# Altium schematic sheet Power Regulation and Interfaces.SchDoc
size A4; SPICEModelCacheAAATKUSZ: <root> / <DocumentId>AAATKUSZ</DocumentId> / </root>; Organization: ORGANIZATION; Address1: ADDRESS 1; Address2: ADDRESS 2; Address3: ADDRESS 3; Address4: ADDRESS 4; Revision: *.*.*; SheetNumber: 1; SheetTotal: 2
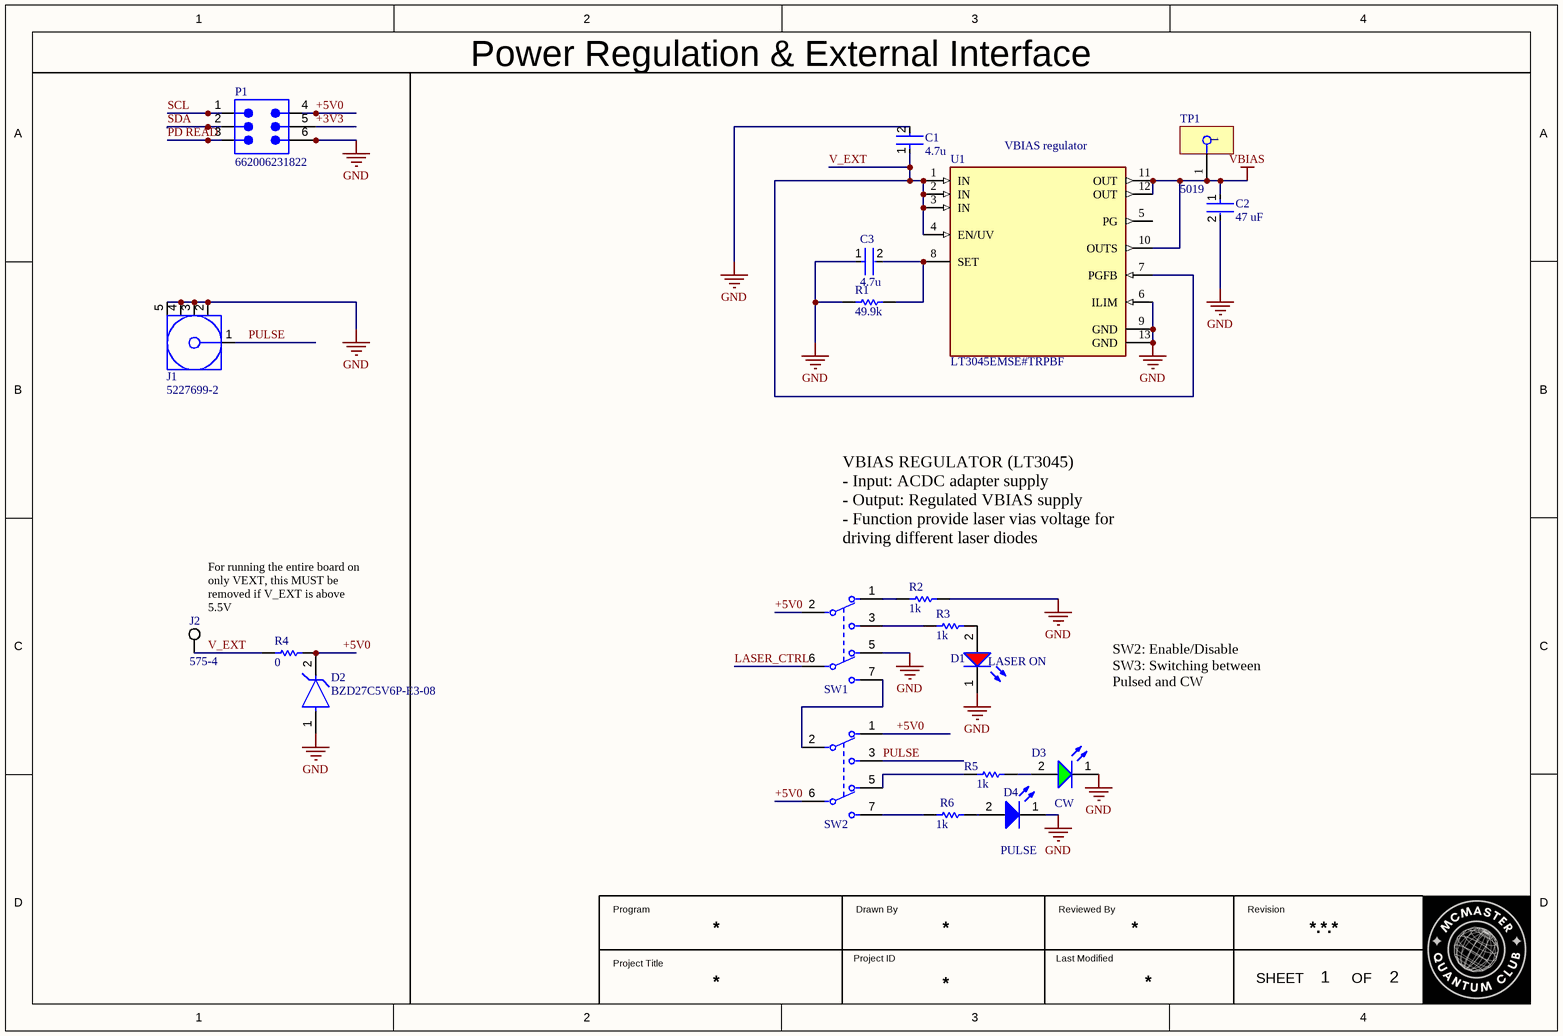
[diagram p0: Power Regulation and Interfaces.SchDoc]

## Parts
C1  4.7u  [FP-CC0402-MFG]
C2  47 uF  [FP-GRM188-0_2-MFG]
C3  4.7u  [FP-CC0402-MFG]
D1  LASER ON  [WL-SMCW_0805_150080xx75000]
D2  BZD27C5V6P-E3-08  [FP-S8-V-3915_01-001-MFG]
D3  CW  [WL-SMCW_0805_150080xx75000]
D4  PULSE  [WL-SMCW_0805_150080xx75000]
J1  5227699-2  [TECO-5227699-2_V]
J2  575-4  [KSTN-575-4]
P1  662006231822  [662006231822]
R1  49.9k  [RESC1005X40X25NL05T05]
R2  1k  [RESC2013X60X35ML10T20]
R3  1k  [RESC2013X60X35ML10T20]
R4  0  [RESC1005X40X25NL05T10]
R5  1k  [RESC2013X60X35ML10T20]
R6  1k  [RESC2013X60X35ML10T20]
SW1  JS202011JCQN  [FP-JS202011JCQN-MFG]  (value not drawn)
SW2  JS202011JCQN  [FP-JS202011JCQN-MFG]  (value not drawn)
TP1  5019  [5019_MFG]
U1  LT3045EMSE#TRPBF  [FP-MSE-12-05-08-1666-IPC_B]

## Nets
GND: C1.2 C2.2 C3.1 D1.1(K) D2.1(A) D3.1(K) D4.1(K) J1.2 J1.3 J1.4 J1.5 P1.6 R1.1 R2.2 SW1.5 U1.6(ILIM) U1.9(GND) U1.13(GND)
VBIAS: C2.1 TP1.1 U1.10(OUTS) U1.11(OUT) U1.12(OUT)
+3V3: P1.5
+5V0: D2.2(C) P1.4 R4.2 SW1.2(1_C) SW2.1 SW2.6(2_C)
LASER_CTRL: SW1.6(2_C)
PD READ: P1.3
PULSE: J1.1 SW2.3
SCL: P1.1
SDA: P1.2
V_EXT: C1.1 J2.1 R4.1 U1.1(IN) U1.2(IN) U1.3(IN) U1.4(EN/UV) U1.7(PGFB)
NetC3_2: C3.2 R1.2 U1.8(SET)
NetD1_2: D1.2(A) R3.2
NetD3_2: D3.2(A) R5.2
NetD4_2: D4.2(A) R6.2
NetR2_1: R2.1 SW1.1
NetR3_1: R3.1 SW1.3
NetR5_1: R5.1 SW2.5
NetR6_1: R6.1 SW2.7
NetSW1_7: SW1.7 SW2.2(1_C)

Not connected (* = marked no-connect by the designer): U1 5(PG)

## Notes on the sheet
- Power Regulation & External Interface
- (near U1) VBIAS regulator
- Type @ to refer to a designator
- VBIAS REGULATOR (LT3045)
  - Input: ACDC adapter supply
  - Output: Regulated VBIAS supply
  - Function provide laser vias voltage for driving different laser diodes
- For running the entire board on only VEXT, this MUST be removed if V_EXT is above 5.5V
- (near D3) SW2: Enable/Disable
  SW3: Switching between Pulsed and CW
- Program
- Drawn By
- Reviewed By
- Revision
- Project Title
- Project ID
- Last Modified
- SHEET
- OF

## Library data of the parts
C1 C3 = CMP-03422-001389-1: CAP CER 4.7UF 6.3V X5R 0402; Manufacturer: YAGEO; Manufacturer Part Number: CC0402KRX5R5BB475; Automotive Grade: NA; Tolerance: 0.1; Temperature Coefficient: 30ppm/°C; Material: Ceramic; Category: Cap; Device Class L3: Ceramic Capacitors; Lead Free: Yes; ComponentLink2URL: http://www.yageo.com/documents/recent/UPY-GP_NP0_16V-to-50V_16.pdf; Value: 4.7 uF; Voltage Rating: 6.3 V; Device Class L1: Passive Components; Height: 0.55mm; Device Class L2: Capacitors; Octopart: https://octopart.com/cc0402krx5r5bb475-yageo-71498076; Temperature Characteristic: X5R; ComponentLink2Description: Datasheet; Temperature Range High: +125°C; Ipc Land Pattern Name: CAPC10050X50; RoHS: TRUE; Capacitance: 4.7 uF; Package: CC0402; Digikey Description: CAP CER 4.7UF 6.3V X5R 0402; Automotive: No; Mouser Description: 0402 4.7 uF 6.3 V ±10% Tolerance X5R SMT Multilayer Ceramic Capacitor; Temperature Range Low: -55°C; Temperature: -55°C to +125°C; Footprint Url: http://www.yageo.com/exep/pages/download/literatures/UPY-C_GEN_24.pdf
C2 = CMP-06035-023005-1: Chip Multilayer Ceramic Capacitors for General Purpose, 0603, 47uF, X5R, 15%, 20%, 6.3V
D1 = CMP-1426-00011-5: LED Uni-Color Red 630nm 2-Pin Chip 0805(2012Metric) T/R; Manufacturer Lifecycle Status: ACTIVE; Test Current: 20mA; Forward Voltage: 2V; YEOL: 1 = Estimated lifetime > 10 years; Lens Style: Clear, Rectangular; Max Junction Temperature (Tj): 95°C; Dominant Wavelength: 625nm; Max Reverse Voltage (DC): 5V; Power Dissipation: 72mW; Viewing Angle: 140°; Luminous Intensity: 150mcd; Forward Current: 100mA; Case/Package: 0805; Case Code (Imperial): 0805; RoHS: Compliant; Min Operating Temperature: -40°C; Packaging: Tape and Reel; Peak Wavelength: 630nm; REACH SVHC: Unknown; Max Operating Temperature: 85°C; Lifecycle Status: Production; Length: 2mm; Wavelength: 625nm; Mount: Surface Mount; Manufacturer Package Identifier: 0805 (2012 metric); Case Code (Metric): 2012; Width: 1.25mm; Color: Red; Height: 700µm
D2 = CMP-02541-000005-1: DIODE ZENER 5.6V 800MW DO219AB; Manufacturer: Vishay; Max Reverse Leakage Current: 10uA; Max Junction Temp: +175°C; Zener Impedance: 2Ω; Reverse Voltage: 2V; Forward Current: 0.2A; Max Zener Voltage: 6V; Standoff Height: 0mm; Automotive Grade: NA; Digikey Description: DIODE ZENER 5.6V 800MW DO219AB; Package: S8-V-3915.01-001; RoHS: TRUE; Octopart: https://octopart.com/bzd27c5v6p-e3-08-vishay-30317385; Nom Zener Voltage: 5.6V; Temperature Range Low: -65°C; ComponentLink2Description: Datasheet; ComponentLink2URL: http://www.vishay.com/docs/85153/bzd27series.pdf; Lead Free: Yes; Power Dissipation: 800mW; Manufacturer Part Number: BZD27C5V6P-E3-08; Category: Diode; Height: 1.08mm; Mouser Description: Diode Zener Single 5.6V 800mW 2-Pin DO-219AB T/R; Temperature: -65°C to +175°C; Device Class L2: Diodes; Device Class L3: Zener Diodes; Temperature Range High: +175°C; Automotive: No; Device Class L1: Discrete Semiconductors
D3 = CMP-1426-00007-5: WURTH ELEKTRONIK - 150080GS75000 - LED, Green, SMD, 0805, 30 mA, 3.2 V, 520 nm; Manufacturer Lifecycle Status: ACTIVE; Manufacturer Package Identifier: 0805 (2012 metric); Wavelength: 525nm; Test Current: 20mA; Luminous Intensity: 450mcd; Max Reverse Voltage (DC): 5V; YEOL: 1 = Estimated lifetime > 10 years; Power Dissipation: 105mW; Viewing Angle: 140°; Peak Wavelength: 515nm; Forward Voltage: 3.2V; Forward Current: 100mA; Lens Style: Clear, Rectangular; Max Junction Temperature (Tj): 95°C; Case/Package: 0805; Height: 700µm; Packaging: Tape and Reel; Max Operating Temperature: 85°C; Lifecycle Status: Production; REACH SVHC: Unknown; Length: 2mm; Width: 1.25mm; Mount: Surface Mount; Reverse Voltage: 5V; Dominant Wavelength: 525nm; Case Code (Metric): 2012; RoHS: Compliant; Case Code (Imperial): 0805; Color: Green; Min Operating Temperature: -40°C
D4 = CMP-1426-00008-9: Wurth Elektronik Blue LED, WL-SMCW Series, 0805 (2012), 470nm, 2x1.25x0.7mm; Manufacturer Lifecycle Status: ACTIVE; Manufacturer Package Identifier: 0805 (2012 metric); YEOL: 1 = Estimated lifetime > 10 years; Peak Wavelength: 465nm; Reverse Voltage: 5V; Lens Style: Clear, Rectangular; Luminous Intensity: 145mcd; Power Dissipation: 105mW; Test Current: 20mA; Viewing Angle: 140°; Forward Voltage: 3.2V; Max Junction Temperature (Tj): 95°C; Forward Current: 100mA; Length: 2mm; Width: 1.25mm; Min Operating Temperature: -40°C; Color: Blue; Packaging: Tape and Reel; Lifecycle Status: Production; Height: 700µm; REACH SVHC: Unknown; Case Code (Imperial): 0805; Mount: Surface Mount; Dominant Wavelength: 470nm; Wavelength: 470nm; Lead Free: Lead Free; Case/Package: 0805; Max Reverse Voltage (DC): 5V; Case Code (Metric): 2012; RoHS: Compliant; Max Operating Temperature: 85°C
J1 = CMP-2000-05627-1: Jack BNC Connector, 1 Position, Height 16.26 mm, Tail Length 6.35 mm, -55 to 85 degC, RoHS, Tube; Manufacturer: TE Connectivity; Frequency - Max: 4GHz; Dynamic Catalog: BNCConnectors; Connector Type: Jack,FemaleSockets; Other Names: A32269; Impedance: 50Ohm; 3D Model: 5227699-2.pdf; Contact Termination: Solder; Standard Package: 30; Mounting Technology: ThroughHole; Package Reference: 5227699-2; Category: Connectors,Interconnects; Datasheet URL: http://www.te.com/commerce/DocumentDelivery/DDEController?Action=showdoc&DocId=Customer+Drawing%7F5227699%7FA1%7Fpdf%7FEnglish%7FENG_CD_5227699_A1.pdf%7F5227699-2; Mounting Type: ThroughHole,Flange(Square); Datasheet Version: Rev. A1, 03/2011; Manufacturer URL: http://www.te.com/; RoHS Information: 5227699-2StatementofCompliance; Fastening Type: BayonetLock; Series: BNC; Connector Style: BNC; Family: CoaxialConnectors(RF); Packaging: Bulk; Package Description: Jack BNC Connector, 1 Position, Height 16.26 mm, Tail Length 6.35 mm
J2 = CMP-2000-05649-1: Banana Jack, Non-Insulated, 1-Pin THD, RoHS, Bulk; Manufacturer: Keystone-Electronics; Package Version: Rev. B, 11/1994; Plug/Mating Plug Diameter: StandardBanana; Gender: Female; Package Reference: 575-4; Operating Temperature: -; Contact Material: Brass; Packaging: Bulk; Series: -; Category: Connectors,Interconnects; Color: -; Type: BananaJack; Contact Finish: Nickel; Features: -; Family: BananaandTipConnectors-Jacks,Plugs; Body Material: -; Manufacturer URL: http://www.keyelco.com/; Termination: Solder; Insulation: Non-Insulated; Datasheet Version: Rev. B, 11/1994; Mounting Technology: ThroughHole; Package URL: http://www.keyelco.com/product-pdf.cfm?p=2379; Mounting Type: ThroughHole; Package Description: 1-Pin Through Hole Device, Dia 7.92 mm; Datasheet URL: http://www.keyelco.com/product-pdf.cfm?p=2379; Wire Gauge: -
P1 = CMP-1502-00342-3: Header, 3.00MM, SMT Male Dual Row Vertical, SMT Solder Tab, SMT, Tin, 6 Pins; Number of Positions: 6; Current Rating: 5A; Row Spacing: 2.9972mm; Pitch: 3mm; Contact Resistance: 10mΩ; Insulation Resistance: 1GΩ; Connector Type: Male Pin, Socket; Operating Supply Voltage: 250V; RoHS: Compliant; Termination: Solder; Contact Plating: Tin; Height: 9.9mm; Gender: Male; Color: Black; Min Operating Temperature: -40°C; Number of Contacts: 6; Length: 12.7mm; Lead Pitch: 3mm; Width: 12.7mm; Orientation: Vertical; Contact Material: Copper; Housing Material: Nylon; Number of Rows: 2; Max Operating Temperature: 105°C; Mount: Surface Mount; Number of Pins: 6; Fastening Type: Ramp
R1 = CMP-2002-00036-1: Manufacturer: Vishay Dale; Part Number: CRCW0402499KFKTD
R2 R3 R5 R6 = CMP-2100-03671-1: Chip Resistor, 1 KOhm, +/- 1%, 125 mW, -55 to 155 degC, 0805 (2012 Metric), RoHS, Tape and Reel; Manufacturer: Yageo; Temperature Coefficient: 100ppm/degreesC; Voltage Rating (DC): 150V; Max Power Dissipation: 125mW; Resistance: 1KOhm; Number of Pins: 2; Number of Terminations: 2; Datasheet URL: http://www.yageo.com/NewPortal/yageodocoutput?fileName=/pdf/R-Chip/PYu-RC_Group_51_RoHS_L_5.pdf; Length: 0.079inch; Package Description: 2-Pin Surface Mounted Device, Body 2 x 1.25 mm; Depth: 1.25mm; Height: 0.024inch; Military Standard: Not; Case/Package: 0805; Package Reference: 0805; RoHSCompliant: true; Lead Free: LeadFree; Packaging: TapeandReel; Package Quantity: 1; Datasheet Version: Rev. 5, 10/2016; Tolerance: 1%; Min Operating Temperature: -55degC; Voltage Rating: 150V; Composition: ThickFilm; Case Code (Imperial): 0805; Power Rating: 125mW; Width: 0.049inch; Case Code (Metric): 2012; Manufacturer URL: http://www.yageo.com/; Max Operating Temperature: 155degC; REACH SVHC: Unknown; Termination: SMD/SMT
R4 = CMP-1011-00001-2: Manufacturer: Yageo / Phycomp; Part Number: RC0402JR-070RL
SW1 SW2 = CMP-10038-000009-1: SWITCH SLIDE DPDT 300MA 6V; Actuator Material: Nylon; Actuator Length: 2mm; Actuator Type: Standard; Electrical Life: 5000Cycles; Switch Function: On-On; Mount: Surface Mount; Current Rating: 300mA; Contact Material: Copper Alloy; Voltage Rating (DC): 6V; Throw Configuration: DPDT; Packaging: Cut Tape; Contact Plating: Silver; Min Operating Temperature: -40°C; Switch Travel: 2mm; Max Operating Temperature: 85°C
TP1 = CMP-1672-00008-3: Phosphor Bronze Contact Miniature Silver Plated Surface Mount Test Points; Number of Contacts: 1; ComponentLink1Description: Manufacturer's Website; Number of Pins: 1; Height: 2.42mm; Mount: Surface Mount; HelpURL: https://www.keyelco.com/product-pdf.cfm?p=1357; REACH SVHC: Yes; Packaging: Tape and Reel; Lead Free: Lead Free; ComponentLink1URL: http://www.keyelco.com/; Termination: SMD/SMT; Material: Bronze; Contact Plating: Silver; Contact Material: Silver; RoHS: Compliant; ComponentLink2URL: https://www.keyelco.com/product-pdf.cfm?p=1357; China RoHS: Compliant; Lifecycle Status: Production; ComponentLink2Description: Datasheet URL
U1 = CMP-09138-000053-1: IC REG LINEAR 0V 500MA 12MSOP; Case/Package: MSOP; RoHS Compliant: Yes